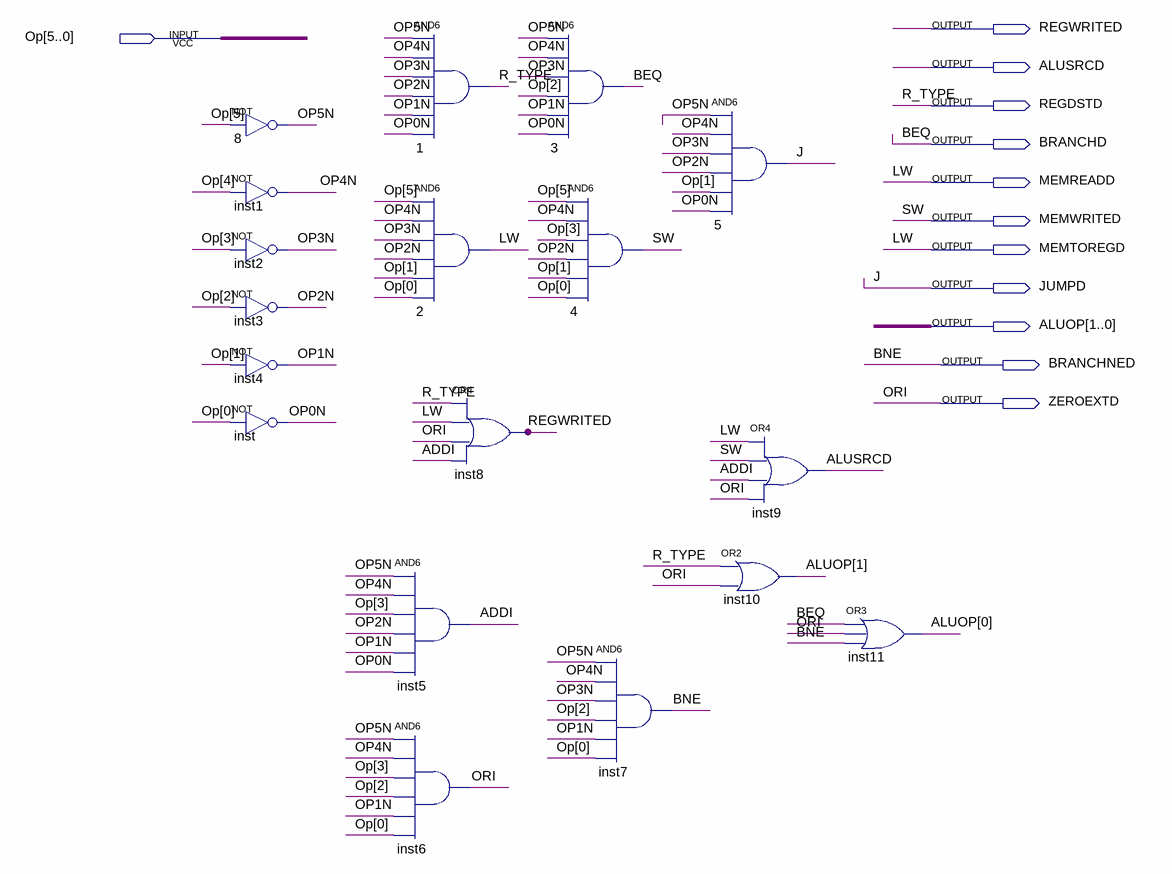
[diagram p0: schematic sheet]
// Quartus schematic DECODER_MAIN.bdf as structural Verilog: 18 symbols, 12 pins
module DECODER_MAIN (
  input  [5:0] Op,
  output REGWRITED,
  output ALUSRCD,
  output REGDSTD,
  output BRANCHD,
  output MEMREADD,
  output MEMWRITED,
  output MEMTOREGD,
  output JUMPD,
  output [1:0] ALUOP,
  output BRANCHNED,
  output ZEROEXTD
);

  wire ADDI, OP0N, OP1N, OP2N, OP3N, OP4N, OP5N;

  not u_8 (OP5N, Op[5]);
  not inst1 (OP4N, Op[4]);
  not inst2 (OP3N, Op[3]);
  not inst3 (OP2N, Op[2]);
  not inst4 (OP1N, Op[1]);
  not inst (OP0N, Op[0]);
  and u_1 (REGDSTD, OP5N, OP4N, OP3N, OP2N, OP1N, OP0N);
  and u_2 (MEMREADD, Op[5], OP4N, OP3N, OP2N, Op[1], Op[0]);
  or inst8 (REGWRITED, REGDSTD, MEMREADD, ZEROEXTD, ADDI);
  and inst5 (ADDI, OP5N, OP4N, Op[3], OP2N, OP1N, OP0N);
  and inst6 (ZEROEXTD, OP5N, OP4N, Op[3], Op[2], OP1N, Op[0]);
  and u_3 (BRANCHD, OP5N, OP4N, OP3N, Op[2], OP1N, OP0N);
  and u_4 (MEMWRITED, Op[5], OP4N, Op[3], OP2N, Op[1], Op[0]);
  and inst7 (BRANCHNED, OP5N, OP4N, OP3N, Op[2], OP1N, Op[0]);
  and u_5 (JUMPD, OP5N, OP4N, OP3N, OP2N, Op[1], OP0N);
  or inst9 (ALUSRCD, MEMREADD, MEMWRITED, ADDI, ZEROEXTD);
  or inst10 (ALUOP[1], REGDSTD, ZEROEXTD);
  or inst11 (ALUOP[0], BRANCHD, ZEROEXTD, BRANCHNED);

  assign MEMTOREGD = MEMREADD;

  // Other names for the same wires on the sheet: BEQ = BRANCHD; BNE = BRANCHNED; J = JUMPD; LW = MEMREADD;
  //   ORI = ZEROEXTD; R_TYPE = REGDSTD; SW = MEMWRITED
endmodule
